# Altium project Hackster1.PrjPcb (part 4 of 4)

## Sheet STM32Clone1_12.STM32_Blue_Pill_Clone.schdoc
size 289 x 200 mm; Name: default297x210; Symbol: default297x210; Device: default297x210; Size: "A4"; Id: /; File: 12.STM32 Blue Pill Clone; Sheet: /; SheetNumber: 16; SheetTotal: 17
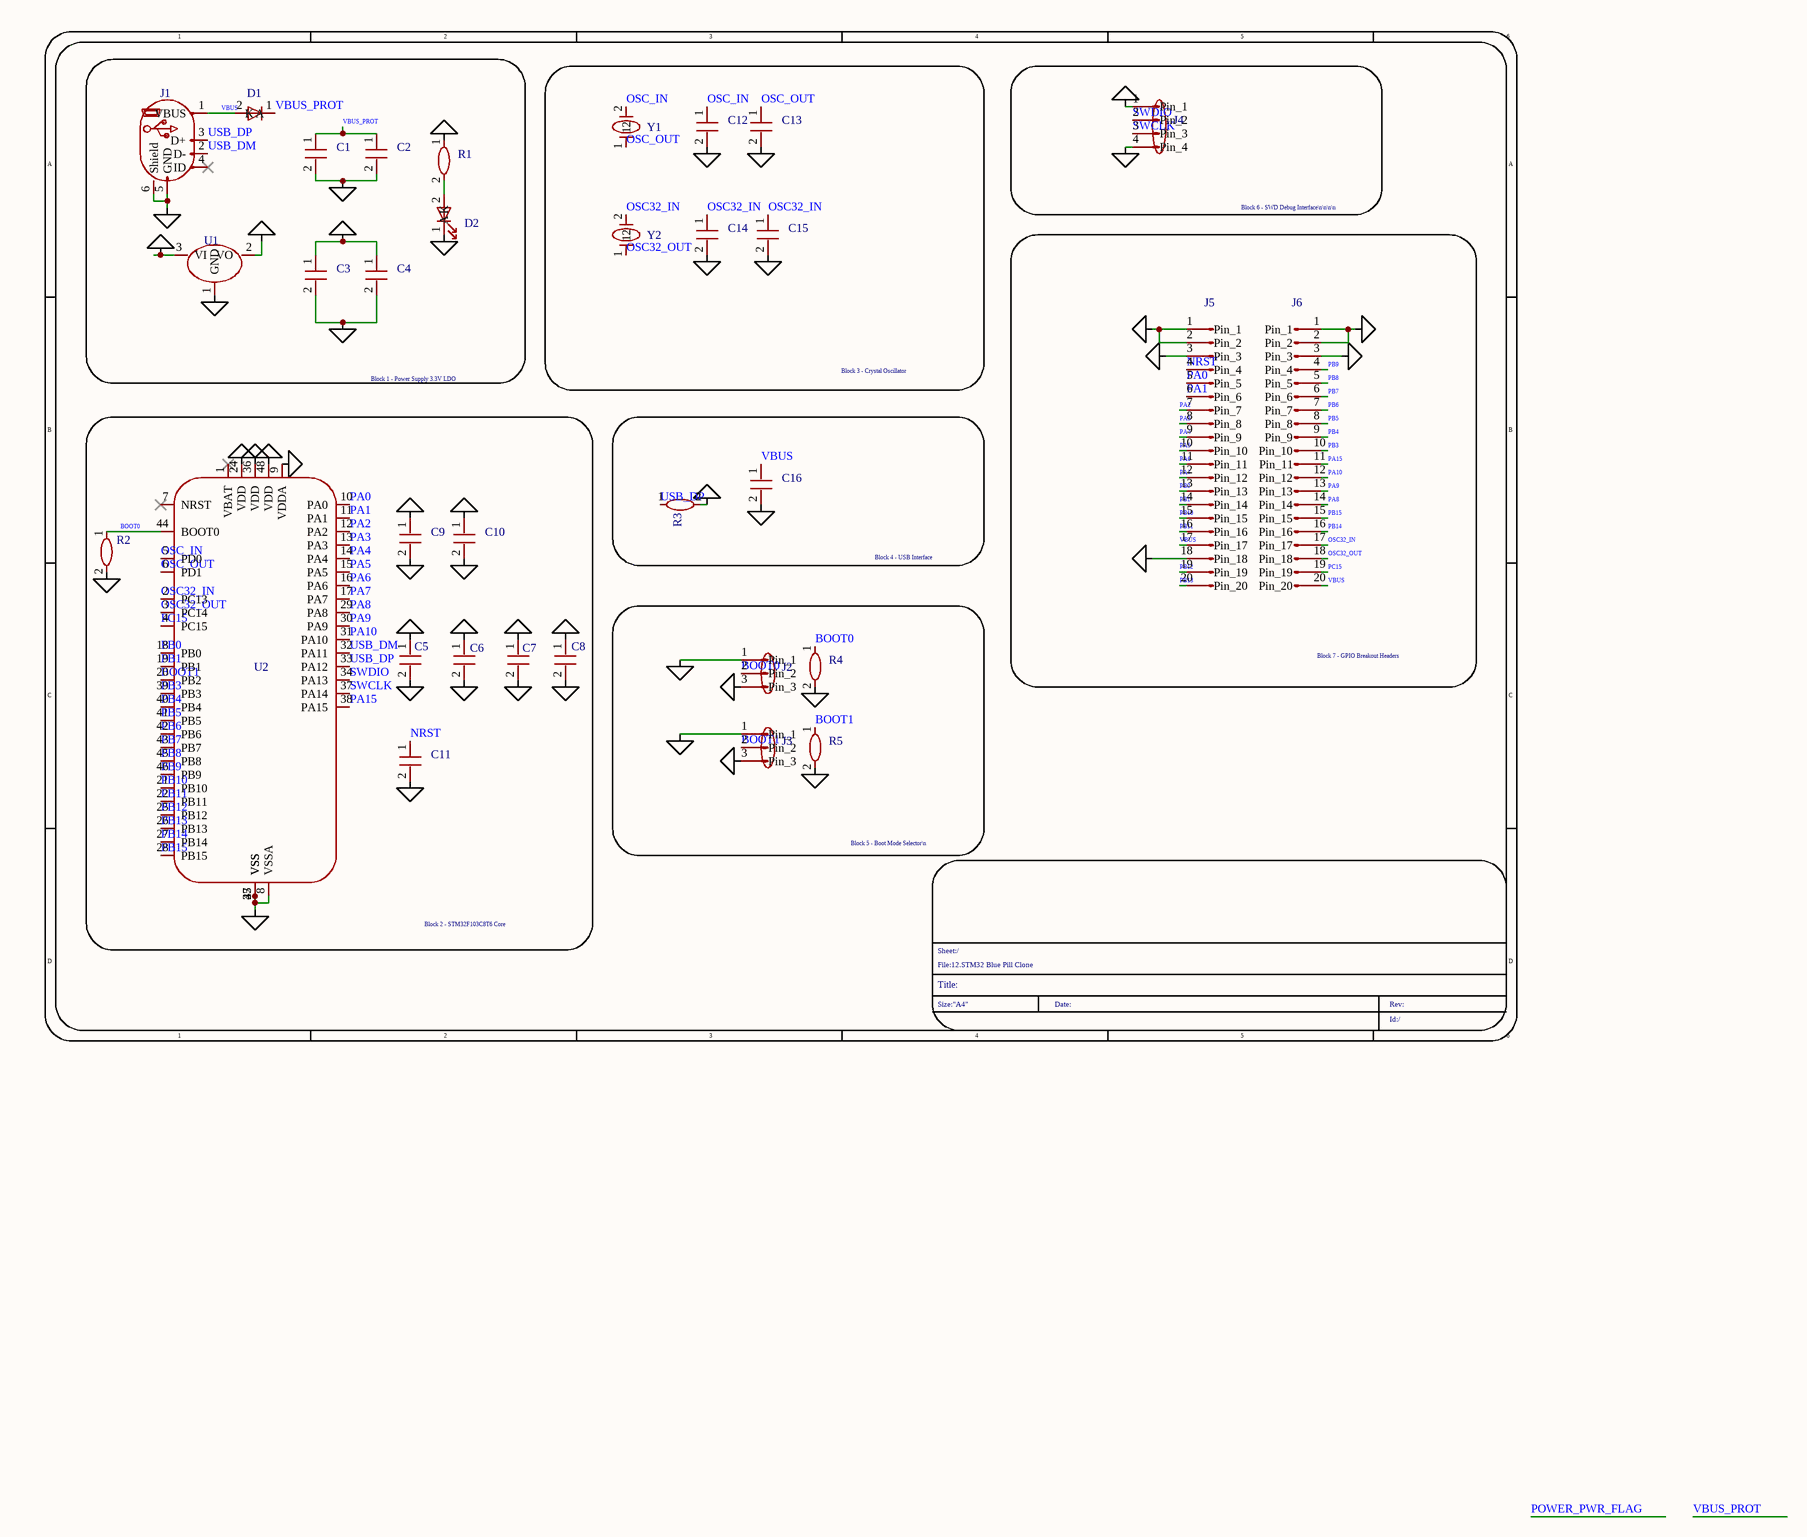
[diagram p15: STM32Clone1_12.STM32_Blue_Pill_Clone.schdoc]

### Parts
(Parts that share a designator on the sheet are numbered #1, #2 ... from top to bottom, then left to right.)
C1#3  Device_C  (value not drawn)
C2#3  Device_C  (value not drawn)
C3#2  Device_C  (value not drawn)
C4#2  Device_C  (value not drawn)
C5#2  Device_C  (value not drawn)
C6#2  Device_C  (value not drawn)
C7#2  Device_C  (value not drawn)
C8#2  Device_C  (value not drawn)
C9  Device_C  (value not drawn)
C10#2  Device_C  (value not drawn)
C11#2  Device_C  (value not drawn)
C12#2  Device_C  (value not drawn)
C13#2  Device_C  (value not drawn)
C14#2  Device_C  (value not drawn)
C15  Device_C  (value not drawn)
C16  Device_C  (value not drawn)
D1  Device_D  (value not drawn)
D2#2  Device_LED  (value not drawn)
J1#2  Connector_USB_B_Micro  (value not drawn)
J2  Connector_Generic_Conn_01x03  (value not drawn)
J3  Connector_Generic_Conn_01x03  (value not drawn)
J4  Connector_Generic_Conn_01x04  (value not drawn)
J5  Connector_Conn_01x20_Pin  (value not drawn)
J6  Connector_Conn_01x20_Pin  (value not drawn)
R1#3  Device_R  (value not drawn)
R2#3  Device_R  (value not drawn)
R3#3  Device_R  (value not drawn)
R4#3  Device_R  (value not drawn)
R5#2  Device_R  (value not drawn)
U1#2  Regulator_Linear_AMS1117-3.3  (value not drawn)
U2  MCU_ST_STM32F1_STM32F103C8Tx  (value not drawn)
Y1  Device_Crystal  (value not drawn)
Y2  Device_Crystal  (value not drawn)

### Blocks framed on the sheet
Block 1 - Power Supply 3.3V LDO: C1#3 C2#3 C3#2 C4#2 D1 D2#2 J1#2 R1#3 U1#2
Block 3 - Crystal Oscillator: C12#2 C13#2 C14#2 C15 Y1 Y2
Block 6 - SWD Debug Interface\n\n\n\n: J4
Block 7 - GPIO Breakout Headers: J5 J6
Block 2 - STM32F103C8T6 Core: C5#2 C6#2 C7#2 C8#2 C9 C10#2 C11#2 R2#3 U2
Block 4 - USB Interface: C16 R3#3
Block 5 - Boot Mode Selector\n: J2 J3 R4#3 R5#2

### Nets
POWER_+3V3: C3#2.1 C4#2.1 C5#2.1 C6#2.1 C7#2.1 C8#2.1 C9.1 C10#2.1 J2.3(Pin_3) J3.3(Pin_3) J4.1(Pin_1) J5.3(Pin_3) J6.3(Pin_3) R1#3.1 R3#3.2 U1#2.2(VO) U2.9(VDDA) U2.24(VDD) U2.36(VDD) U2.48(VDD)
POWER_GND: C1#3.2 C2#3.2 C3#2.2 C4#2.2 C5#2.2 C6#2.2 C7#2.2 C8#2.2 C9.2 C10#2.2 C11#2.2 C12#2.2 C13#2.2 C14#2.2 C15.2 C16.2 D2#2.1(K) J1#2.5(GND) J1#2.6(Shield) J2.1(Pin_1) J3.1(Pin_1) J4.4(Pin_4) J5.1(Pin_1) J5.2(Pin_2) J5.18(Pin_18) J6.1(Pin_1) J6.2(Pin_2) R2#3.2 R4#3.2 R5#2.2 U1#2.1(GND) U1#2.3(VI) U2.8(VSSA) U2.23(VSS) U2.35(VSS) U2.47(VSS)  [also labelled POWER_PWR_FLAG]  [project net BATT-]
BOOT0: J2.2(Pin_2) R2#3.1 R4#3.1 U2.44(BOOT0)
BOOT1: J3.2(Pin_2) R5#2.1 U2.20(PB2)
NRST: C11#2.1 J5.4(Pin_4)
OSC32_IN: C14#2.1 C15.1 J6.17(Pin_17) U2.2(PC13) Y2.2
OSC32_OUT: J6.18(Pin_18) U2.3(PC14) Y2.1
OSC_IN: C12#2.1 U2.5(PD0) Y1.2
OSC_OUT: C13#2.1 U2.6(PD1) Y1.1
PA0: J5.5(Pin_5) U2.10(PA0)
PA1: J5.6(Pin_6) U2.11(PA1)
PA2: J5.7(Pin_7) U2.12(PA2)
PA3: J5.8(Pin_8) U2.13(PA3)
PA4: J5.9(Pin_9) U2.14(PA4)
PA5: J5.10(Pin_10) U2.15(PA5)
PA6: J5.11(Pin_11) U2.16(PA6)
PA7: J5.12(Pin_12) U2.17(PA7)
PA8: J6.14(Pin_14) U2.29(PA8)
PA9: J6.13(Pin_13) U2.30(PA9)
PA10: J6.12(Pin_12) U2.31(PA10)
PA15: J6.11(Pin_11) U2.38(PA15)
PB0: J5.13(Pin_13) U2.18(PB0)
PB1: J5.14(Pin_14) U2.19(PB1)
PB3: J6.10(Pin_10) U2.39(PB3)
PB4: J6.9(Pin_9) U2.40(PB4)
PB5: J6.8(Pin_8) U2.41(PB5)
PB6: J6.7(Pin_7) U2.42(PB6)
PB7: J6.6(Pin_6) U2.43(PB7)
PB8: J6.5(Pin_5) U2.45(PB8)
PB9: J6.4(Pin_4) U2.46(PB9)
PB10: J5.15(Pin_15) U2.21(PB10)
PB11: J5.16(Pin_16) U2.22(PB11)
PB12: J5.19(Pin_19) U2.25(PB12)
PB13: J5.20(Pin_20) U2.26(PB13)
PB14: J6.16(Pin_16) U2.27(PB14)
PB15: J6.15(Pin_15) U2.28(PB15)
PC15: J6.19(Pin_19) U2.4(PC15)
SWCLK: J4.3(Pin_3) U2.37(PA14)
SWDIO: J4.2(Pin_2) U2.34(PA13)
USB_DM: J1#2.2(D-) U2.32(PA11)
USB_DP: J1#2.3(D+) R3#3.1 U2.33(PA12)
VBUS: C16.1 D1.2(A) J1#2.1(VBUS) J5.17(Pin_17) J6.20(Pin_20)
VBUS_PROT: C1#3.1 C2#3.1 D1.1(K)
NetD2#2_2: D2#2.2(A) R1#3.2

Not connected (* = marked no-connect by the designer): J1#2 4(ID)*; U2 1(VBAT)* 7(NRST)*

### Notes on the sheet
- 1
- 2
- 3
- 4
- 5
- 6
- A
- B
- C
- D
- File:12.STM32 Blue Pill Clone
- Sheet:/
- Size:"A4"
- Title:
- Date:
- Rev:
- Id:/

### Library data of the parts
C1#3 C3#2 = Device_C: Value: 10uF; Add into BOM: yes; Origin Footprint: Capacitor_SMD:C_0805_2012Metric; Symbol: Device_C; Device: Device_C; User doc link: ~; Convert to PCB: yes
C2#3 C4#2 C16 = Device_C: Value: 100nF; Add into BOM: yes; Origin Footprint: Capacitor_SMD:C_0402_1005Metric; Symbol: Device_C; Device: Device_C; User doc link: ~; Convert to PCB: yes
C5#2 C6#2 C7#2 C8#2 C9 = Device_C: Value: 100nf; Add into BOM: yes; Origin Footprint: Capacitor_SMD:C_0402_1005Metric; Symbol: Device_C; Device: Device_C; User doc link: ~; Convert to PCB: yes
C10#2 C11#2 = Device_C: Value: 1uf; Add into BOM: yes; Origin Footprint: Capacitor_SMD:C_0402_1005Metric; Symbol: Device_C; Device: Device_C; User doc link: ~; Convert to PCB: yes
C12#2 C13#2 = Device_C: Value: 20PF; Add into BOM: yes; Origin Footprint: Capacitor_SMD:C_0402_1005Metric; Symbol: Device_C; Device: Device_C; User doc link: ~; Convert to PCB: yes
C14#2 C15 = Device_C: Value: 12.5pF; Add into BOM: yes; Origin Footprint: Capacitor_SMD:C_0402_1005Metric; Symbol: Device_C; Device: Device_C; User doc link: ~; Convert to PCB: yes
D1 = Device_D: Value: 1N5819; Sim_Device: D; Sim_Pins: 1=K 2=A; Add into BOM: yes; Origin Footprint: Diode_SMD:D_SOD-123; Symbol: Device_D; Device: Device_D; User doc link: ~; Convert to PCB: yes; Sim.Device: D; Sim.Pins: 1=K 2=A
D2#2 = Device_LED: Value: PWR_LED; Sim_Pins: 1=K 2=A; Add into BOM: yes; Origin Footprint: LED_SMD:LED_0805_2012Metric; Symbol: Device_LED; Device: Device_LED; User doc link: ~; Convert to PCB: yes; Sim.Pins: 1=K 2=A
J1#2 = Connector_USB_B_Micro: Add into BOM: yes; Origin Footprint: Connector_USB:USB_Micro-B_Amphenol_10118194_Horizontal; Symbol: Connector_USB_B_Micro; Device: Connector_USB_B_Micro; Value: USB_B_Micro; User doc link: ~; Convert to PCB: yes
J2 = Connector_Generic_Conn_01x03: Value: BOOT0_SEL; Add into BOM: yes; Origin Footprint: Connector_PinHeader_2.54mm:PinHeader_1x03_P2.54mm_Vertical; Symbol: Connector_Generic_Conn_01x03; Device: Connector_Generic_Conn_01x03; User doc link: ~; Convert to PCB: yes
J3 = Connector_Generic_Conn_01x03: Value: BOOT1_SEL; Add into BOM: yes; Origin Footprint: Connector_PinHeader_2.54mm:PinHeader_1x03_P2.54mm_Vertical; Symbol: Connector_Generic_Conn_01x03; Device: Connector_Generic_Conn_01x03; User doc link: ~; Convert to PCB: yes
J4 = Connector_Generic_Conn_01x04: Value: SWD; Add into BOM: yes; Origin Footprint: Connector_PinHeader_2.54mm:PinHeader_1x03_P2.54mm_Vertical; Symbol: Connector_Generic_Conn_01x04; Device: Connector_Generic_Conn_01x04; User doc link: ~; Convert to PCB: yes
J5 = Connector_Conn_01x20_Pin: Value: LEFT_HEADER; Add into BOM: yes; Origin Footprint: Connector_PinHeader_2.54mm:PinHeader_1x03_P2.54mm_Vertical; Symbol: Connector_Conn_01x20_Pin; Device: Connector_Conn_01x20_Pin; User doc link: ~; Convert to PCB: yes
J6 = Connector_Conn_01x20_Pin: Value: RIGHT_HEADER; Add into BOM: yes; Origin Footprint: Connector_PinHeader_2.54mm:PinHeader_1x03_P2.54mm_Vertical; Symbol: Connector_Conn_01x20_Pin; Device: Connector_Conn_01x20_Pin; User doc link: ~; Convert to PCB: yes
R1#3 = Device_R: Value: 1k; Add into BOM: yes; Origin Footprint: Resistor_SMD:R_0402_1005Metric; Symbol: Device_R; Device: Device_R; User doc link: ~; Convert to PCB: yes
R2#3 R4#3 R5#2 = Device_R: Value: 10k; Add into BOM: yes; Origin Footprint: Resistor_SMD:R_0402_1005Metric; Symbol: Device_R; Device: Device_R; User doc link: ~; Convert to PCB: yes
R3#3 = Device_R: Value: 1.5K; Add into BOM: yes; Origin Footprint: Resistor_SMD:R_0402_1005Metric; Symbol: Device_R; Device: Device_R; User doc link: ~; Convert to PCB: yes
U1#2 = Regulator_Linear_AMS1117-3.3: Add into BOM: yes; Origin Footprint: Package_TO_SOT_SMD:SOT-223-3_TabPin2; Symbol: Regulator_Linear_AMS1117-3.3; Device: Regulator_Linear_AMS1117-3.3; Value: AMS1117-3.3; User doc link: http://www.advanced-monolithic.com/pdf/ds1117.pdf; Convert to PCB: yes
U2 = MCU_ST_STM32F1_STM32F103C8Tx: Value: STM32F103C8T6; Add into BOM: yes; Origin Footprint: Package_QFP:LQFP-48_7x7mm_P0.5mm; Symbol: MCU_ST_STM32F1_STM32F103C8Tx; Device: MCU_ST_STM32F1_STM32F103C8Tx; User doc link: https://www.st.com/resource/en/datasheet/stm32f103c8.pdf; Convert to PCB: yes
Y1 = Device_Crystal: Value: 8MHz; Add into BOM: yes; Origin Footprint: Crystal:Crystal_SMD_3225-4Pin_3.2x2.5mm; Symbol: Device_Crystal; Device: Device_Crystal; User doc link: ~; Convert to PCB: yes
Y2 = Device_Crystal: Value: 32.768kHz; Add into BOM: yes; Origin Footprint: Crystal:Crystal_SMD_3215-2Pin_3.2x1.5mm; Symbol: Device_Crystal; Device: Device_Crystal; User doc link: ~; Convert to PCB: yes

## Sheet V_Divider_Solarb.SchDoc
size A4; SheetNumber: 15; SheetTotal: 17
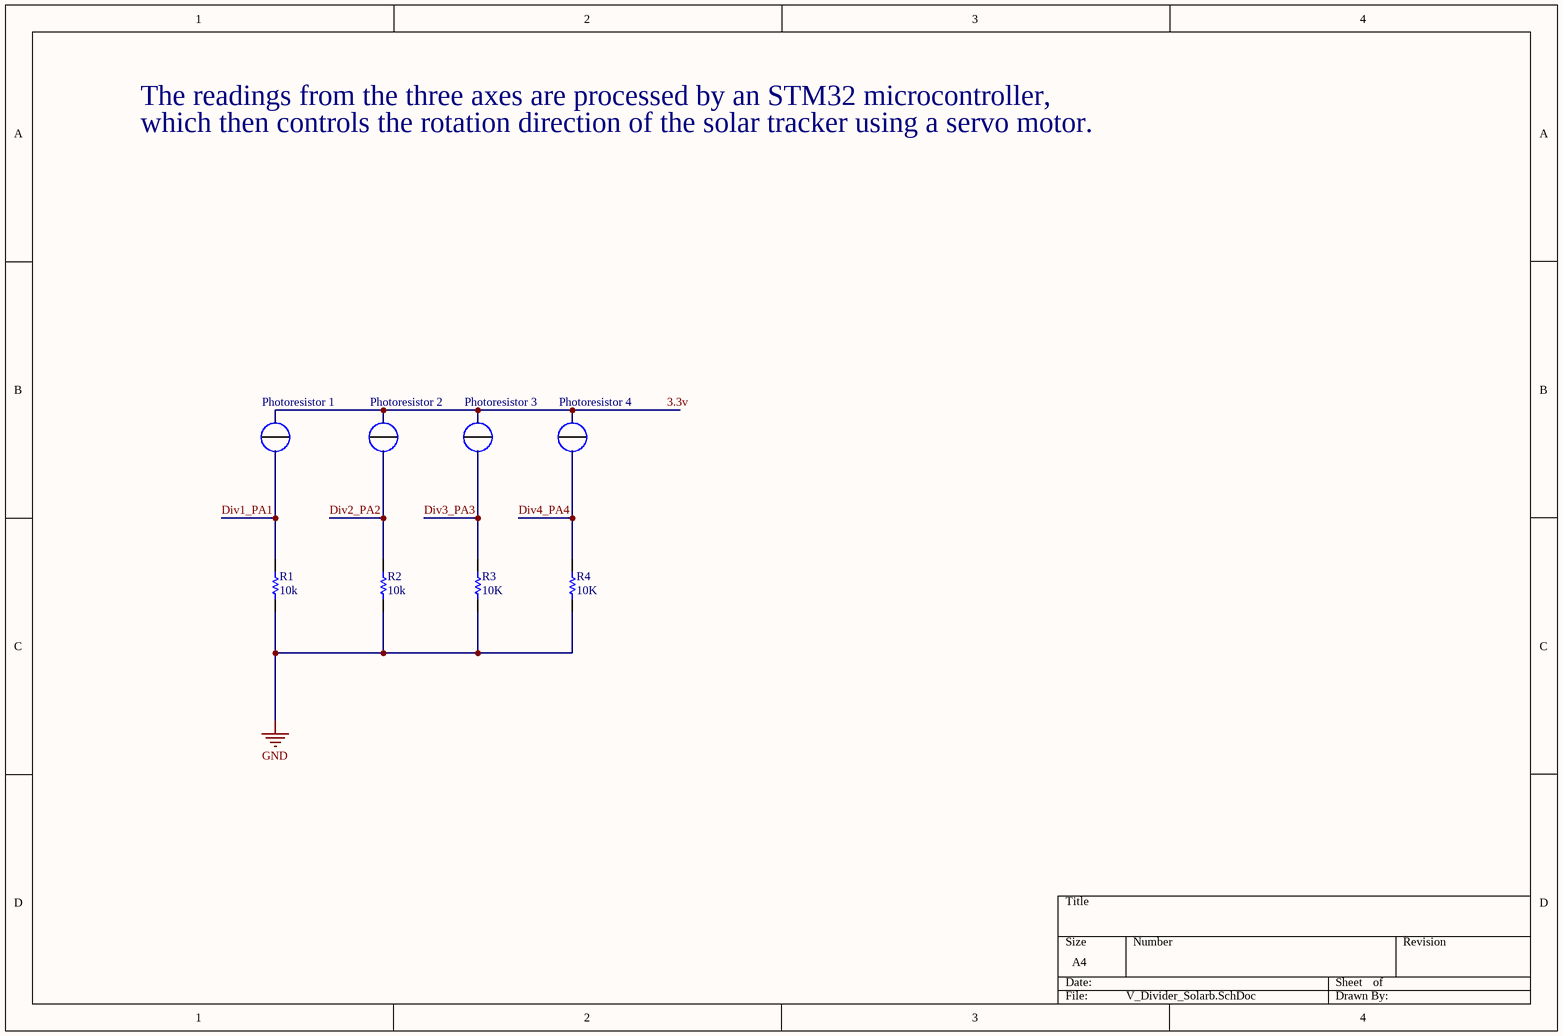
[diagram p16: V_Divider_Solarb.SchDoc]

### Parts
(Parts that share a designator on the sheet are numbered #1, #2 ... from top to bottom, then left to right.)
R1#4  10k  [RESC0603X26X15LL03T05]
R2#4  10k  [RESC0603X26X15LL03T05]
R3#4  10K  [RESC0603X26X15LL03T05]
R4#4  10K  [RESC0603X26X15LL03T05]

### Nets
GND: R1#4.1 R2#4.1 R3#4.1 R4#4.1  [project net ENB]
Div1_PA1: R1#4.2
Div2_PA2: R2#4.2
Div3_PA3: R3#4.2
Div4_PA4: R4#4.2

### Notes on the sheet
- The readings from the three axes are processed by an STM32 microcontroller,
- which then controls the rotation direction of the solar tracker using a servo motor.
- Photoresistor 1
- Photoresistor 2
- Photoresistor 3
- Photoresistor 4

### Library data of the parts
R1#4 R2#4 R3#4 R4#4 = CMP-2004-03568-1: Manufacturer: TE Connectivity / AMP; Part Number: CRG0201F10K

## Nets that join several sheets
1.8V: Power supply (C8_Power_supply#1.1 P3_Power_supply#1.2 R6_Power_supply#1.2 U4_Power_supply#1.4), Power supply (C8_Power_supply#2.1 P3_Power_supply#2.2 R6_Power_supply#2.2 U4_Power_supply#2.4)
3V3: Power supply (7 pins), Power supply (7 pins)
5V: Power supply (10 pins), Power supply (10 pins)
15V,VIN: Power supply (C4_Power_supply#1.1 P4_Power_supply#1.2 U1_Power_supply#1.4), Power supply (C4_Power_supply#2.1 P4_Power_supply#2.2 U1_Power_supply#2.4)
24V,VIN: Power supply (CIN_Power_supply#1.2 U1_Power_supply#1.3), Power supply (CIN_Power_supply#2.2 U1_Power_supply#2.3)
A1.2V: Power supply (C11_Power_supply#1.1 P6_Power_supply#1.2 U5_Power_supply#1.5), Power supply (C11_Power_supply#2.1 P6_Power_supply#2.2 U5_Power_supply#2.5)
A3V3: Power supply (C12_Power_supply#1.1 P5_Power_supply#1.2 U7_Power_supply#1.1), Power supply (C12_Power_supply#2.1 P5_Power_supply#2.2 U7_Power_supply#2.1)
BATT-: Battery Charger (26 pins), Battery BMS_li_b (24 pins), Charging Orbit (6 pins), STM32Clone1_12.STM32_Blue_Pill_Clone (36 pins), Battery Charger (26 pins), Battery BMS_li_b (24 pins), Charging Orbit (6 pins)
ENB: Power supply (39 pins), pca10184_power_supply (42 pins), pca10184_nrf54lm20 (29 pins), pca10184_misc (18 pins), pca10184_level_shifters (22 pins), pca10184_switches (12 pins), MAX3485Schmematic (5 pins), Power supply (39 pins), V_Divider_Solarb (R1#4.1 R2#4.1 R3#4.1 R4#4.1)
P5V0:LED: pca10184_power_supply (C52.2 TP1.1 U3.31), pca10184_misc (R25.2 R26.2 R27.2 R28.2)
POWER_+3.3V: Charging Orbit (J1_Charging_Orbit#1.2), Charging Orbit (J1_Charging_Orbit#2.2)
POWER_+BATT: Battery Charger (7 pins), Battery Charger (7 pins)
POWER_VCC: Charging Orbit (J1_Charging_Orbit#1.15), Charging Orbit (J1_Charging_Orbit#2.15)
VBUS:nRF: pca10184_power_supply (SB6.2), pca10184_nrf54lm20 (R1#1.2)
VCC: Power supply (2_Power_supply#1.1 R1_Power_supply#1.2), Power supply (2_Power_supply#2.1 R1_Power_supply#2.2)
VDD:DBGR: pca10184_power_supply (C54.1 U3.12), pca10184_misc (R35.2), pca10184_level_shifters (10 pins)
VDD:IO: pca10184_power_supply (6 pins), pca10184_misc (SB23.1), pca10184_level_shifters (7 pins)
VDD:nRF: pca10184_power_supply (P14.2 R15.1 R55.1 SB19.2), pca10184_nrf54lm20 (9 pins), pca10184_misc (SB24.1), pca10184_level_shifters (R43.1)
VDD:SW: pca10184_level_shifters (10 pins), pca10184_switches (C61.1 C62.1 U15.14 U16.14)
VDD:SW_PU: pca10184_level_shifters (7 pins), pca10184_switches (R56.2)
NetSB22_1: pca10184_top_level (SB25.2 SB26.1), pca10184_misc (SB22.1 SW6.2)
NFC_N: pca10184_nrf54lm20 (R3#1.2 U1#1.J6), pca10184_misc (R33.1)
NFC_P: pca10184_nrf54lm20 (R4#1.2 U1#1.J7), pca10184_misc (R34.1)
nRF54_RESET: pca10184_top_level (SB25.1), pca10184_nrf54lm20 (U1#1.F2), pca10184_level_shifters (U7.9)
P0.05: pca10184_nrf54lm20 (U1#1.H3), pca10184_misc (SW4.2)
P0.06: pca10184_nrf54lm20 (U1#1.H2), pca10184_level_shifters (U5.6)
P0.07: pca10184_nrf54lm20 (U1#1.G3), pca10184_level_shifters (U5.3)
P0.08: pca10184_nrf54lm20 (U1#1.F3), pca10184_level_shifters (U5.13)
P0.09: pca10184_nrf54lm20 (U1#1.E3), pca10184_level_shifters (U5.9)
P1.08: pca10184_nrf54lm20 (U1#1.F8), pca10184_misc (SW3.2)
P1.09: pca10184_nrf54lm20 (U1#1.E8), pca10184_misc (SW2.2)
P1.16: pca10184_nrf54lm20 (U1#1.B3), pca10184_level_shifters (U6.6)
P1.17: pca10184_nrf54lm20 (U1#1.B4), pca10184_level_shifters (U6.3)
P1.18: pca10184_nrf54lm20 (U1#1.B5), pca10184_level_shifters (U6.13)
P1.19: pca10184_nrf54lm20 (U1#1.B6), pca10184_level_shifters (U6.9)
P1.22: pca10184_nrf54lm20 (U1#1.D6), pca10184_misc (Q4.1 R32.1)
P1.25: pca10184_nrf54lm20 (U1#1.E7), pca10184_misc (Q5.1 R29.1)
P1.26: pca10184_nrf54lm20 (U1#1.B8), pca10184_misc (SW1.2)
P1.27: pca10184_nrf54lm20 (U1#1.C8), pca10184_misc (Q6.1 R30.1)
P1.28: pca10184_nrf54lm20 (U1#1.D8), pca10184_misc (Q7.1 R31.1)
P2.00: pca10184_nrf54lm20 (U1#1.B10), pca10184_switches (TP13.1 U15.2)
P2.00_B: pca10184_misc (U4.7), pca10184_switches (U15.1)
P2.01: pca10184_nrf54lm20 (U1#1.C10), pca10184_switches (TP29.1 U15.5)
P2.01_B: pca10184_misc (U4.6), pca10184_switches (U15.4)
P2.02: pca10184_nrf54lm20 (U1#1.D10), pca10184_switches (TP30.1 U15.7)
P2.02_B: pca10184_misc (U4.5), pca10184_switches (U15.8)
P2.03: pca10184_nrf54lm20 (U1#1.E10), pca10184_switches (TP31.1 U16.2)
P2.03_B: pca10184_misc (U4.3), pca10184_switches (U16.1)
P2.04: pca10184_nrf54lm20 (U1#1.F10), pca10184_switches (TP32.1 U16.7)
P2.04_B: pca10184_misc (U4.2), pca10184_switches (U16.8)
P2.05: pca10184_nrf54lm20 (U1#1.G9), pca10184_switches (TP33.1 U16.10)
P2.05_B: pca10184_misc (U4.1), pca10184_switches (U16.11)
P2.07: pca10184_nrf54lm20 (U1#1.C9), pca10184_level_shifters (U7.13)
SWDCLK: pca10184_nrf54lm20 (U1#1.G1), pca10184_level_shifters (U7.6)
SWDIO: pca10184_nrf54lm20 (U1#1.G2), pca10184_level_shifters (U7.3)